# Altium schematic sheet Load cell_Sheet.SchDoc
size A4; SheetNumber: 4; SheetTotal: 4
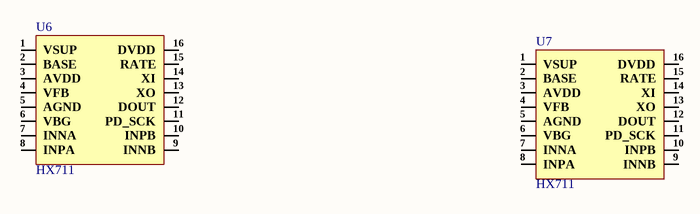
[diagram p0: Load cell_Sheet.SchDoc]

## Parts
U6  HX711  [SOP-16]
U7  HX711  [SOP-16]

## Nets

Not connected (* = marked no-connect by the designer): U6 1(VSUP) 2(BASE) 3(AVDD) 4(VFB) 5(AGND) 6(VBG) 7(INNA) 8(INPA) 9(INNB) 10(INPB) 11(PD_SCK) 12(DOUT) 13(XO) 14(XI) 15(RATE) 16(DVDD); U7 1(VSUP) 2(BASE) 3(AVDD) 4(VFB) 5(AGND) 6(VBG) 7(INNA) 8(INPA) 9(INNB) 10(INPB) 11(PD_SCK) 12(DOUT) 13(XO) 14(XI) 15(RATE) 16(DVDD)

## Notes on the sheet
- File:
- Title:
- Date:
- Page
- Num:
- Total:
- Drawn By: Huzaifa Ali

## Library data of the parts
U6 U7 = HX711: 2.7V~5.5V 24Bit SOP-16 Analog to Digital Converters (ADC) ROHS; Manufacturer: Avia Semicon (Xiamen); Item Type: IC; Manufacturer Part Number: HX711; Package: SOP-16; LCSC Part Number: C6705483; ComponentLink1Description: LCSC; ComponentLink1URL: https://www.lcsc.com/product-detail/Analog-to-Digital-Converters-ADC_Avia-Semicon-Xiamen-HX711_C6705483.html